# Altium schematic sheet FPGA_Decoupling.SchDoc
size A4
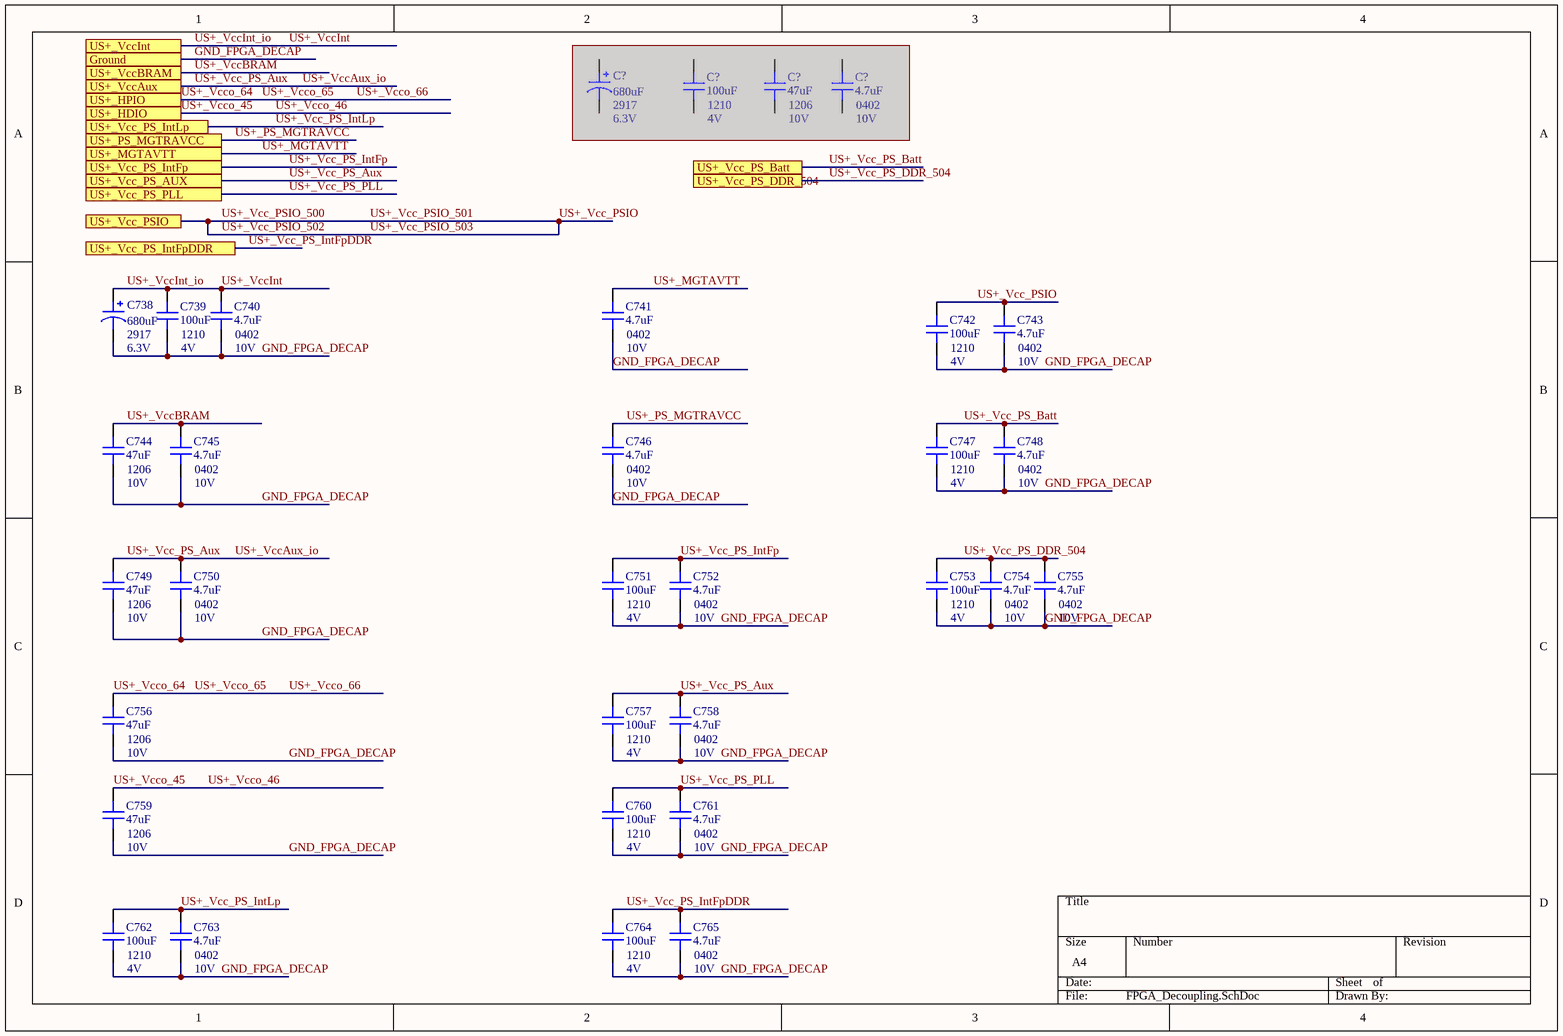
[diagram p0: FPGA_Decoupling.SchDoc]

## Parts
(Parts that share a designator on the sheet are numbered #1, #2 ... from top to bottom, then left to right.)
C738  Case/Package: 2917  Capacitance: 680uF  Voltage: 6.3V  [CAP POL 2917/7343]  (hidden comment: 6TPE680MI)
C739  100uF  Case Code (Imperial): 1210  Voltage Rating: 4V  [CAP 1210/3225 - 1MM]
C740  4.7uF  Case/Package: 0402  Voltage Rating: 10V  [CAP 0402/1005 KK]
C741  4.7uF  Case/Package: 0402  Voltage Rating: 10V  [CAP 0402/1005 KK]
C742  100uF  Case Code (Imperial): 1210  Voltage Rating: 4V  [CAP 1210/3225 - 1MM]
C743  4.7uF  Case/Package: 0402  Voltage Rating: 10V  [CAP 0402/1005 KK]
C744  47uF  Case/Package: 1206  Voltage Rating: 10V  [CAP 1206/3216 - 0.8MM]
C745  4.7uF  Case/Package: 0402  Voltage Rating: 10V  [CAP 0402/1005 KK]
C746  4.7uF  Case/Package: 0402  Voltage Rating: 10V  [CAP 0402/1005 KK]
C747  100uF  Case Code (Imperial): 1210  Voltage Rating: 4V  [CAP 1210/3225 - 1MM]
C748  4.7uF  Case/Package: 0402  Voltage Rating: 10V  [CAP 0402/1005 KK]
C749  47uF  Case/Package: 1206  Voltage Rating: 10V  [CAP 1206/3216 - 0.8MM]
C750  4.7uF  Case/Package: 0402  Voltage Rating: 10V  [CAP 0402/1005 KK]
C751  100uF  Case Code (Imperial): 1210  Voltage Rating: 4V  [CAP 1210/3225 - 1MM]
C752  4.7uF  Case/Package: 0402  Voltage Rating: 10V  [CAP 0402/1005 KK]
C753  100uF  Case Code (Imperial): 1210  Voltage Rating: 4V  [CAP 1210/3225 - 1MM]
C754  4.7uF  Case/Package: 0402  Voltage Rating: 10V  [CAP 0402/1005 KK]
C755  4.7uF  Case/Package: 0402  Voltage Rating: 10V  [CAP 0402/1005 KK]
C756  47uF  Case/Package: 1206  Voltage Rating: 10V  [CAP 1206/3216 - 0.8MM]
C757  100uF  Case Code (Imperial): 1210  Voltage Rating: 4V  [CAP 1210/3225 - 1MM]
C758  4.7uF  Case/Package: 0402  Voltage Rating: 10V  [CAP 0402/1005 KK]
C759  47uF  Case/Package: 1206  Voltage Rating: 10V  [CAP 1206/3216 - 0.8MM]
C760  100uF  Case Code (Imperial): 1210  Voltage Rating: 4V  [CAP 1210/3225 - 1MM]
C761  4.7uF  Case/Package: 0402  Voltage Rating: 10V  [CAP 0402/1005 KK]
C762  100uF  Case Code (Imperial): 1210  Voltage Rating: 4V  [CAP 1210/3225 - 1MM]
C763  4.7uF  Case/Package: 0402  Voltage Rating: 10V  [CAP 0402/1005 KK]
C764  100uF  Case Code (Imperial): 1210  Voltage Rating: 4V  [CAP 1210/3225 - 1MM]
C765  4.7uF  Case/Package: 0402  Voltage Rating: 10V  [CAP 0402/1005 KK]
C?#1  Case/Package: 2917  Capacitance: 680uF  Voltage: 6.3V  [CAP POL 2917/7343]  (hidden comment: 6TPE680MI)  (masked out: inside a compile mask, not in the netlist)
C?#2  100uF  Case Code (Imperial): 1210  Voltage Rating: 4V  [CAP 1210/3225 - 1MM]  (masked out: inside a compile mask, not in the netlist)
C?#3  47uF  Case/Package: 1206  Voltage Rating: 10V  [CAP 1206/3216 - 0.8MM]  (masked out: inside a compile mask, not in the netlist)
C?#4  4.7uF  Case/Package: 0402  Voltage Rating: 10V  [CAP 0402/1005 KK]  (masked out: inside a compile mask, not in the netlist)

## Ports
Ground, US+_HDIO, US+_HPIO, US+_MGTAVTT, US+_PS_MGTRAVCC, US+_Vcc_PS_AUX, US+_Vcc_PS_Batt, US+_Vcc_PS_DDR_504, US+_Vcc_PS_IntFp, US+_Vcc_PS_IntFpDDR, US+_Vcc_PS_IntLp, US+_Vcc_PS_PLL, US+_Vcc_PSIO, US+_VccAux, US+_VccBRAM, US+_VccInt

## Nets
GND_FPGA_DECAP: C738.2 C739.2 C740.1 C741.1 C742.2 C743.1 C744.1 C745.1 C746.1 C747.2 C748.1 C749.1 C750.1 C751.2 C752.1 C753.2 C754.1 C755.1 C756.1 C757.2 C758.1 C759.1 C760.2 C761.1 C762.2 C763.1 C764.2 C765.1 ; port Ground
US+_MGTAVTT: C741.2 ; port US+_MGTAVTT
US+_PS_MGTRAVCC: C746.2 ; port US+_PS_MGTRAVCC
US+_Vcc_PS_Aux: C749.2 C750.2 C757.1 C758.2 ; port US+_VccAux, port US+_Vcc_PS_AUX  [also labelled US+_VccAux_io]
US+_Vcc_PS_Batt: C747.1 C748.2 ; port US+_Vcc_PS_Batt
US+_Vcc_PS_DDR_504: C753.1 C754.2 C755.2 ; port US+_Vcc_PS_DDR_504
US+_Vcc_PS_IntFp: C751.1 C752.2 ; port US+_Vcc_PS_IntFp
US+_Vcc_PS_IntFpDDR: C764.1 C765.2 ; port US+_Vcc_PS_IntFpDDR
US+_Vcc_PS_IntLp: C762.1 C763.2 ; port US+_Vcc_PS_IntLp
US+_Vcc_PS_PLL: C760.1 C761.2 ; port US+_Vcc_PS_PLL
US+_Vcc_PSIO: C742.1 C743.2 ; port US+_Vcc_PSIO  [also labelled US+_Vcc_PSIO_500, US+_Vcc_PSIO_501, US+_Vcc_PSIO_502, US+_Vcc_PSIO_503]
US+_VccBRAM: C744.2 C745.2 ; port US+_VccBRAM
US+_VccInt: C738.1 C739.1 C740.2 ; port US+_VccInt  [also labelled US+_VccInt_io]
US+_Vcco_45: C759.2 ; port US+_HDIO  [also labelled US+_Vcco_46]
US+_Vcco_64: C756.2 ; port US+_HPIO  [also labelled US+_Vcco_65, US+_Vcco_66]

## Library data of the parts
C738 C?#1 = 6TPE680MI: CAP TANT POLY 680UF 6.3V 2917; Manufacturer: Panasonic; Tolerance: 20%; ESR (Equivalent Series Resistance): 18mR; Ripple Current: 3.5A; Leakage Current: 428.4uA; Polarity: Polar; Dissipation Factor: 15%; Supplier 1: Digi-Key; Manufacturer Part Number: 6TPE680MI; Stock 1: 3579; Pricing 1: 1 = 3,36000, 10 = 2,71700, 100 = 2,07450, 500 = 1,58056, 1000 = 1,38299 (USD); RoHS: Yes; Mount: Surface Mount; Number of Pins: 4; Case Code (Metric): 7343; Case Code (Imperial): 2917; Min Operating Temperature: -55°C; Max Operating Temperature: 105°C; Packaging: Tape and Reel; Package Quantity: 1; Voltage Rating: 6.3V; Voltage Rating (DC): 6.3V; Termination: SMD/SMT; Length: 7.3mm; Height: 3.8mm; Width: 0.169inch; Height - Seated (Max): 0.157inch; Depth: 4.3mm; Radiation Hardening: No; REACH SVHC: No SVHC; Lead Free: Lead Free; ComponentLink1URL: https://datasheet.ciiva.com/24022/tpe-os-262406-24022136.pdf?src-supplier=Mouser; ComponentLink1Description: https://datasheet.ciiva.com/24022/tpe-os-262406-24022136.pdf?src-supplier=Mouser; ComponentLink2URL: https://datasheet.ciiva.com/26840/getdatasheetpartid-750514-26840938.pdf?src-supplier=Verical; ComponentLink2Description: https://datasheet.ciiva.com/26840/getdatasheetpartid-750514-26840938.pdf?src-supplier=Verical; ComponentLink3URL: https://datasheet.ciiva.com/22745/1734363-22745373.pdf?src-supplier=Element14; ComponentLink3Description: https://datasheet.ciiva.com/22745/1734363-22745373.pdf?src-supplier=Element14; ComponentLink4URL: https://datasheet.ciiva.com/25786/1734363-25786077.pdf?src-supplier=Farnell; ComponentLink4Description: https://datasheet.ciiva.com/25786/1734363-25786077.pdf?src-supplier=Farnell; Supplier Part Number 1: P16633CT-ND
C739 C742 C747 C751 C753 C757 C760 C762 C764 C?#2 = Capacitor: Manufacturer: Murata; Manufacturer Part Number: GRM32EE70G107ME19L; Material: Ceramic; Tolerance: 20%; Dielectric: X7U; Supplier 1: Digi-Key; Supplier Part Number 1: 490-6534-1-ND; Stock 1: 22860; Pricing 1: 1 = 1,39000, 10 = 1,10100, 100 = 0,82570, 500 = 0,62386 (USD); RoHS: Yes; Mount: Surface Mount; Case/Package: 1210; Number of Pins: 2; Case Code (Metric): 3225; Min Operating Temperature: -55°C; Max Operating Temperature: 125°C; Capacitance: 100uF; Packaging: Tape and Reel; Voltage Rating (DC): 4V; Package Quantity: 1; Termination: SMD/SMT; Length: 3.2mm; Height: 2.5mm; Width: 2.5mm; Thickness: 0.106inch; Depth: 2.5mm; Lead Pitch: 1mm; Radiation Hardening: No; REACH SVHC: No SVHC; Lead Free: Lead Free; ComponentLink1URL: https://datasheet.ciiva.com/5422/product-5422439.pdf?src-supplier=Mouser; ComponentLink1Description: https://datasheet.ciiva.com/5422/product-5422439.pdf?src-supplier=Mouser; ComponentLink2URL: https://datasheet.ciiva.com/6264/partnumbering-e-01-6264538.pdf?src-supplier=Digi-Key; ComponentLink2Description: https://datasheet.ciiva.com/6264/partnumbering-e-01-6264538.pdf?src-supplier=Digi-Key; ComponentLink3URL: https://datasheet.ciiva.com/7719/1303574-7719178.pdf?src-supplier=Element14; ComponentLink3Description: https://datasheet.ciiva.com/7719/1303574-7719178.pdf?src-supplier=Element14; ComponentLink4URL: https://datasheet.ciiva.com/6264/partnumbering-e-01-6264539.pdf?src-supplier=Digi-Key; ComponentLink4Description: https://datasheet.ciiva.com/6264/partnumbering-e-01-6264539.pdf?src-supplier=Digi-Key; ComponentLink5URL: https://datasheet.ciiva.com/14116/grmseries-highdielectrictype-eng-14116427.pdf?src-supplier=Distrelec; ComponentLink5Description: https://datasheet.ciiva.com/14116/grmseries-highdielectrictype-eng-14116427.pdf?src-supplier=Distrelec; ComponentLink6URL: https://datasheet.ciiva.com/6264/partnumbering-e-01-6264540.pdf?src-supplier=Digi-Key; ComponentLink6Description: https://datasheet.ciiva.com/6264/partnumbering-e-01-6264540.pdf?src-supplier=Digi-Key; ComponentLink7URL: https://datasheet.ciiva.com/11605/product-11605486.pdf?src-supplier=Avnet; ComponentLink7Description: https://datasheet.ciiva.com/11605/product-11605486.pdf?src-supplier=Avnet
C740 C741 C743 C745 C746 C748 C750 C752 C754 C755 C758 C761 C763 C765 C?#4 = Capacitor: Manufacturer: Murata; Manufacturer Part Number: GRM155R61A475MEAAD; Tolerance: 20%; Supplier 1: Digi-Key; Supplier Part Number 1: 490-14306-1-ND; Stock 1: 780543; Pricing 1: 1 = 0,25000, 10 = 0,16900, 100 = 0,08560, 500 = 0,05854, 1000 = 0,05179, 2500 = 0,04954, 5000 = 0,04503 (USD); Mount: Surface Mount; Case Code (Imperial): 0402; Case Code (Metric): 1005; Min Operating Temperature: -55°C; Max Operating Temperature: 85°C; Packaging: Tape and Reel; Capacitance: 4.7uF; ComponentLink1URL: http://www.farnell.com/datasheets/2189109.pdf?src-supplier=Farnell; ComponentLink1Description: http://www.farnell.com/datasheets/2189109.pdf?src-supplier=Farnell; ComponentLink2URL: https://search.murata.co.jp/Ceramy/image/img/A01X/G101/ENG/GRM155R61A475MEAA-01.pdf?src-supplier=Digi-Key; ComponentLink2Description: https://search.murata.co.jp/Ceramy/image/img/A01X/G101/ENG/GRM155R61A475MEAA-01.pdf?src-supplier=Digi-Key; ComponentLink3URL: http://datasheet.octopart.com/GRM155R61A475MEAAD-Murata-datasheet-138740730.pdf?src-supplier=Ciiva+Crawler; ComponentLink3Description: http://datasheet.octopart.com/GRM155R61A475MEAAD-Murata-datasheet-138740730.pdf?src-supplier=Ciiva+Crawler; ComponentLink4URL: http://datasheet.octopart.com/GRM155R61A475MEAAD-Murata-datasheet-68589269.pdf?src-supplier=Newark; ComponentLink4Description: http://datasheet.octopart.com/GRM155R61A475MEAAD-Murata-datasheet-68589269.pdf?src-supplier=Newark; ComponentLink5URL: http://datasheet.octopart.com/GRM155R61A475MEAAD-Murata-datasheet-8819587.pdf; ComponentLink5Description: http://datasheet.octopart.com/GRM155R61A475MEAAD-Murata-datasheet-8819587.pdf; ComponentLink6URL: http://datasheet.octopart.com/GRM155R61A475MEAAD-Murata-datasheet-10025737.pdf; ComponentLink6Description: http://datasheet.octopart.com/GRM155R61A475MEAAD-Murata-datasheet-10025737.pdf; ComponentLink7URL: http://datasheet.octopart.com/GRM155R61A475MEAAD-Murata-datasheet-11978611.pdf; ComponentLink7Description: http://datasheet.octopart.com/GRM155R61A475MEAAD-Murata-datasheet-11978611.pdf; ComponentLink8URL: http://datasheet.octopart.com/GRM155R61A475MEAAD-Murata-datasheet-12510076.pdf; ComponentLink8Description: http://datasheet.octopart.com/GRM155R61A475MEAAD-Murata-datasheet-12510076.pdf; ComponentLink9URL: http://datasheet.octopart.com/GRM155R61A475MEAAD-Murata-datasheet-12515295.pdf; ComponentLink9Description: http://datasheet.octopart.com/GRM155R61A475MEAAD-Murata-datasheet-12515295.pdf
C744 C749 C756 C759 C?#3 = Capacitor: Manufacturer: KEMET; Manufacturer Part Number: C1206C476M8PACTU; Dielectric Material: Ceramic; Tolerance: 20%; Dielectric: X5R; Supplier 1: Digi-Key; Supplier Part Number 1: 399-5508-1-ND; Stock 1: 120241; Pricing 1: 1 = 0,96000, 10 = 0,72900, 100 = 0,52180, 500 = 0,40394, 1000 = 0,34784 (USD); RoHS: Yes; Mount: Surface Mount,PCB; Number of Pins: 2; Case Code (Imperial): 1206; Case Code (Metric): 3216; Contact Plating: Tin,Matte; Min Operating Temperature: -55°C; Max Operating Temperature: 85°C; Packaging: Tape and Reel; Capacitance: 47uF; Voltage Rating (DC): 10V; Package Quantity: 1; Termination: SMD/SMT; Voltage: 10V; Length: 3.2mm; Height: 1.6mm; Width: 1.6mm; Thickness: 0.071inch; Depth: 1.6mm; Radiation Hardening: No; REACH SVHC: No SVHC; Lead Free: Lead Free; ComponentLink1URL: https://datasheet.ciiva.com/22705/1929483-22705482.pdf?src-supplier=Element14; ComponentLink1Description: https://datasheet.ciiva.com/22705/1929483-22705482.pdf?src-supplier=Element14; ComponentLink2URL: https://datasheet.ciiva.com/28608/1918694-28608743.pdf?src-supplier=Element14; ComponentLink2Description: https://datasheet.ciiva.com/28608/1918694-28608743.pdf?src-supplier=Element14